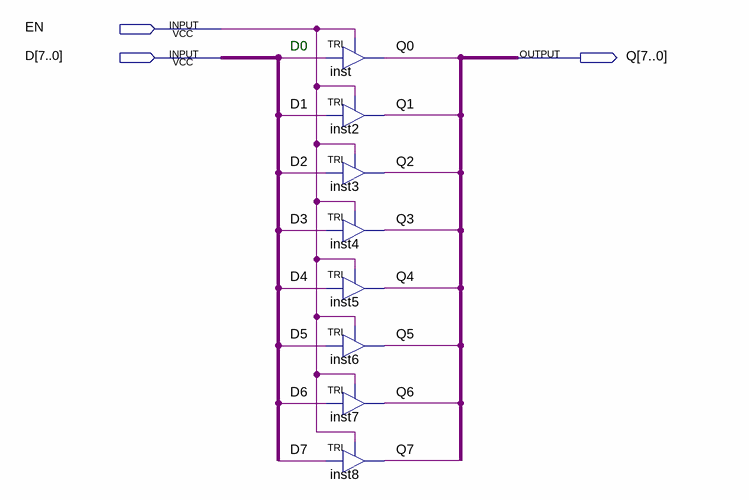
[diagram p0: schematic sheet]
// Quartus schematic tri_8.bdf as structural Verilog: 8 symbols, 3 pins
module tri_8 (
  input  EN,
  input  [7:0] D,
  output [7:0] Q
);

  TRI inst (.IN(D[0]), .OE(EN), .OUT(Q[0]));
  TRI inst2 (.IN(D[1]), .OE(EN), .OUT(Q[1]));
  TRI inst3 (.IN(D[2]), .OE(EN), .OUT(Q[2]));
  TRI inst4 (.IN(D[3]), .OE(EN), .OUT(Q[3]));
  TRI inst5 (.IN(D[4]), .OE(EN), .OUT(Q[4]));
  TRI inst6 (.IN(D[5]), .OE(EN), .OUT(Q[5]));
  TRI inst7 (.IN(D[6]), .OE(EN), .OUT(Q[6]));
  TRI inst8 (.IN(D[7]), .OE(EN), .OUT(Q[7]));

  // Notes on the sheet:
  //   D0
endmodule
